# EasyEDA Pro project ProProject_F4_2025-05-21.epro, board PCB1
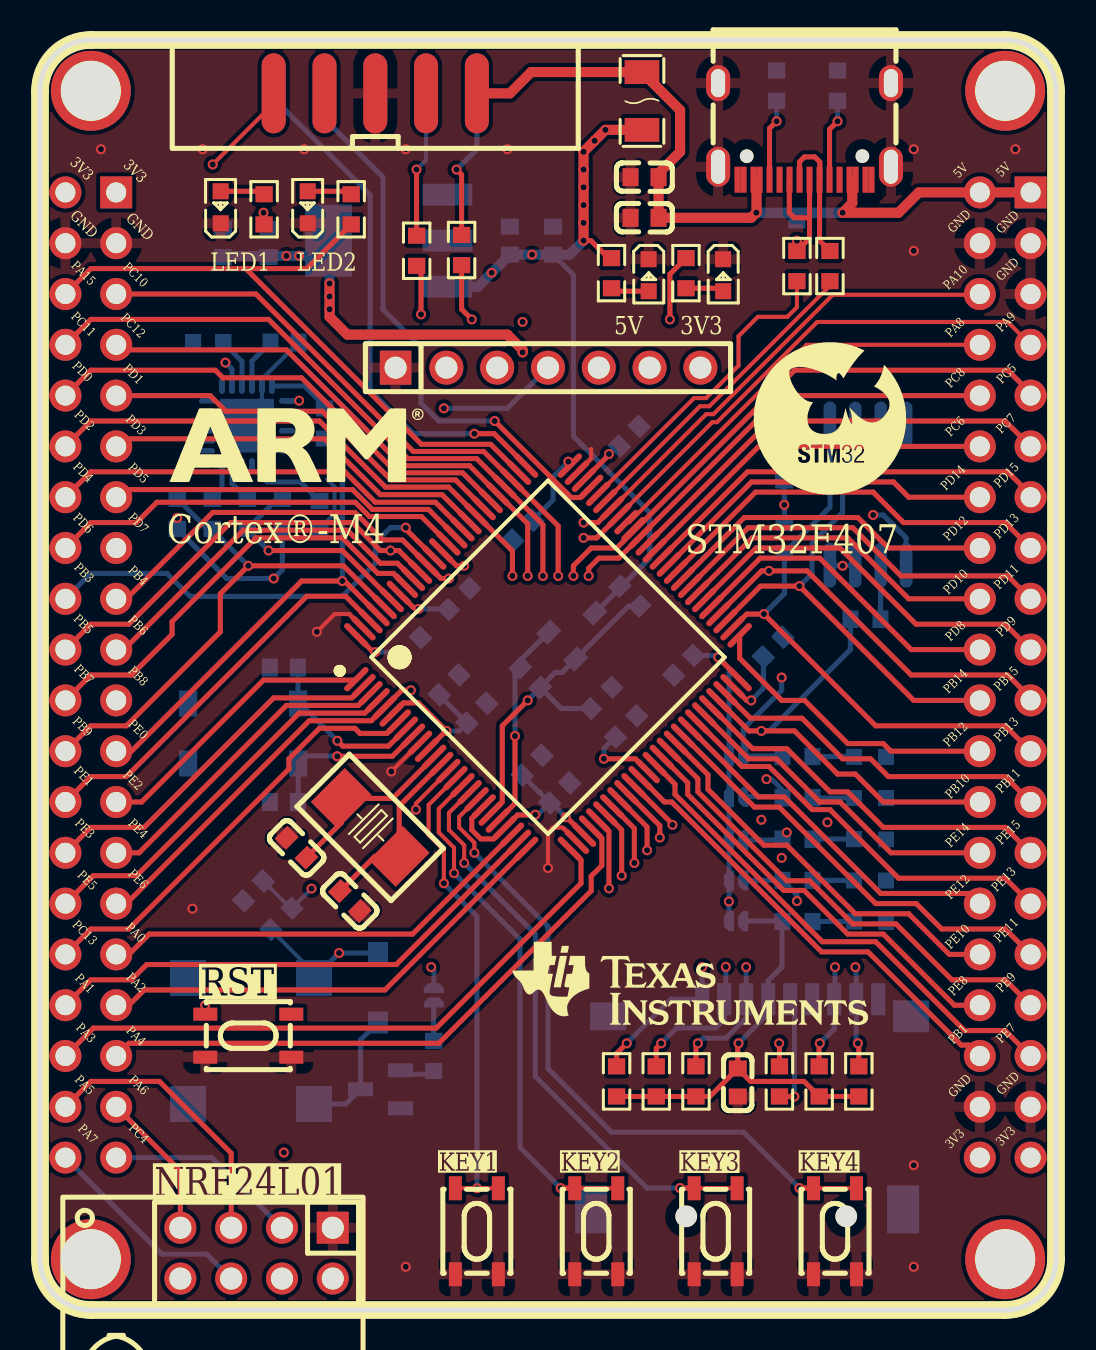
[diagram p10: board, top side]
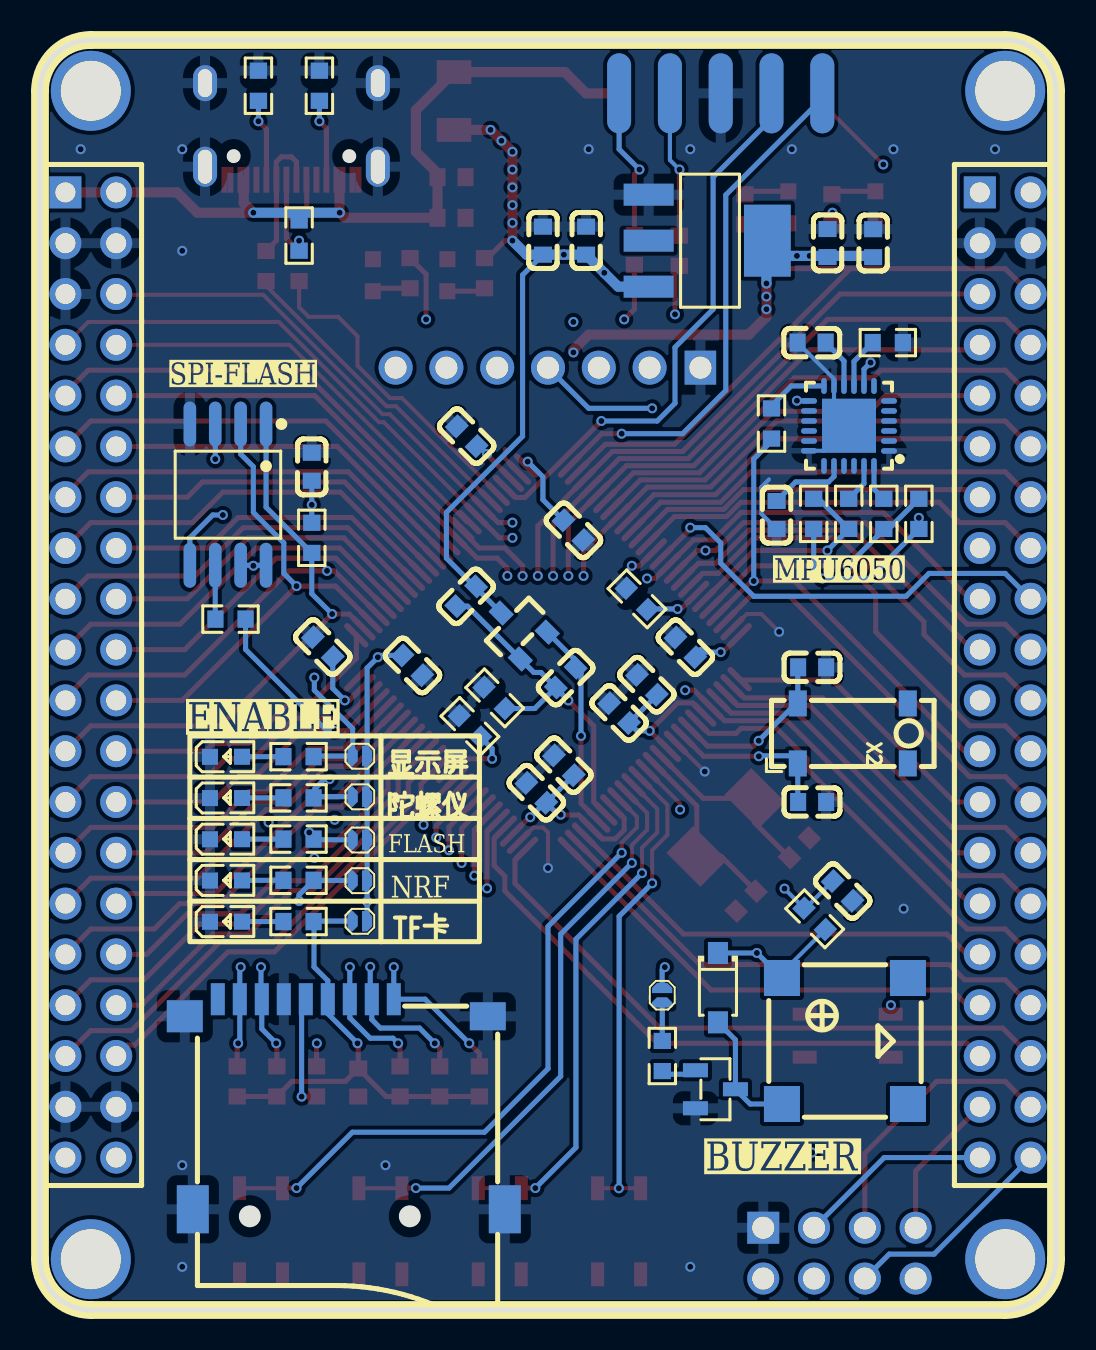
[diagram p11: board, bottom side, seen from below]

Outline 50.8 x 63.5 mm; copper layers: Top Layer, Inner1, Inner2, Bottom Layer. Coordinates in mm from the lower left corner of the outline.
Outline path: 0,60.96 0,2.54 arc(0.74,0.74) 2.54,0 48.26,0 arc(50.06,0.74) 50.8,2.54 50.8,60.96 arc(50.06,62.76) 48.26,63.5 2.54,63.5 arc(0.74,62.76) 0,60.96
Stack: Top Layer 0.035mm 外层铜厚1oz / Dielectric1 0.2104mm 7628 RC49% 8.6mil / Inner1 0.0152mm 内层铜厚 / Dielectric2 1.065mm 1.1mm H/HOZ 含铜 / Inner2 0.0152mm 内层铜厚 / Dielectric3 0.2104mm 7628 RC49% 8.6mil / Bottom Layer 0.035mm 外层铜厚1oz

## Design rules (mm)
net PA12: DP2
net PA11: DP2
net OSC_OUT: DP4
net OSC_IN: DP4
net DP: DP1
net DN: DP1
net OSC32_IN: DP3
net OSC32_OUT: DP3
template: 自定义配置
spacing copperThickness1oz (default): track to track 0.102, other pairs 0.152 to 0.3
spacing copperThickness2oz: track to track 0.203, other pairs 0.152 to 0.3
track width copperThickness1oz (default): min 0.127, default 0.254, max 2.54
track width copperThickness2oz: min 0.203, default 0.254, max 2.54
differential pair differentialPair (default): width min 0.127, default 0.254, max 2.54; gap min 0.152, default 0.152
via viaSize (default): diameter min 0.399, default 0.5, max 10; hole min 0.3, default 0.3, max 6.299

## Placement (name value [footprint] x y rotation side)
BUZZER1  SMD-7525-3627-16Ω  [BUZ-SMD_4P-L7.5-W7.5-BR]  10.55 13.45 0 bottom
C1  100nF  [C0603]  11.42 53.35 270 bottom
C2  10uF  [C0603]  9.14 53.34 270 bottom
C3  100nF  [C0603]  23.5 53.47 270 bottom
C4  10uF  [C0603]  25.65 53.47 270 bottom
C5  10uF  [C0603]  30.23 54.61 0 top
C6  0.1uF  [C0603]  30.23 56.64 0 top
C13  22pF  [C0603]  12.19 25.4 180 bottom
C14  22pF  [C0603]  12.19 32.13 180 bottom
C17  100nF  [C0603]  37.21 42.16 90 bottom
C18  100nF  [C0603]  34.89 11.37 90 top
D2  1N4148W  [SOD-123F_L2.7-W1.6-LS3.8-RD]  16.9 16.12 270 bottom
H1  -  [HDR-TH_7P-P2.54-V-F]  25.4 47.12 0 top
LED1  -  [LED_0603]  41.45 27.67 180 bottom
LED2  -  [LED_0603]  34.16 51.69 270 top
LED3  -  [LED_0603]  41.45 25.61 180 bottom
LED4  -  [LED_0603]  41.45 23.55 180 bottom
LED5  -  [LED_0603]  30.44 51.69 270 top
LED6  -  [LED_0603]  41.45 21.48 180 bottom
LED7  -  [LED_0603]  41.45 19.42 180 bottom
LED8  -  [LED_0603]  9.03 55.19 90 top
LED9  -  [LED_0603]  13.38 55.19 90 top
NOREF  -  [Pad_e925]  48.26 2.54 0 top
NOREF#2  -  [Pad_e112]  48.26 60.96 0 top
NOREF#3  -  [Pad_e923]  2.54 60.96 0 top
NOREF#4  -  [Pad_e924]  2.54 2.54 0 top
NRF24L01  -  [NRF24L01]  8.64 -8.89 90 top
P1  2.54-2*5P简牛  [简牛2*5-2.54]  16.76 60.83 0 top
Q3  SS8050  [SOT-23-3_L2.9-W1.3-P1.90-LS2.4-BR]  17.03 11.04 0 bottom
R3  10kΩ  [R0603]  12.06 19.56 225 bottom
R4  20Ω  [R0603]  18.83 52.96 90 top
R5  20Ω  [R0603]  21.08 53 90 top
R7  1K5  [R0603]  37.85 53.72 270 bottom
R8  180  [R0603]  19.69 12.7 270 bottom
R16  10K  [R0603]  20.95 35.56 45 bottom
R17  0  [R0603]  28.07 30.61 45 bottom
R18  5K1  [R0603]  36.83 61.21 90 bottom
R19  5K1  [R0603]  39.88 61.21 90 bottom
R20  22Ω  [R0603]  37.85 52.2 270 top
R21  22Ω  [R0603]  39.5 52.2 270 top
R22  10K  [R0603]  29.3 29.18 45 bottom
R27  10K  [R0603]  6.86 39.81 270 bottom
R28  10K  [R0603]  12.12 39.81 270 bottom
R29  120R  [R0603]  8.61 39.81 270 bottom
R30  120R  [R0603]  10.36 39.81 270 bottom
R31  120R  [R0603]  14.22 44.32 90 bottom
R32  10K  [R0603]  8.41 48.37 0 bottom
R37  10K  [R0603]  32.8 11.43 270 top
R38  10K  [R0603]  38.96 11.43 270 top
R39  10K  [R0603]  40.94 11.43 270 top
R40  10K  [R0603]  28.83 11.43 270 top
R41  10K  [R0603]  30.81 11.43 270 top
R42  22  [R0603]  36.97 11.43 90 top
R44  22  [R0603]  41.28 34.54 0 bottom
R45  10K  [R0603]  37.21 38.61 90 bottom
R46  10kΩ  [R0603]  37.87 27.67 180 bottom
R47  10kΩ  [R0603]  32.3 51.84 90 top
R48  10kΩ  [R0603]  37.87 25.61 180 bottom
R49  10kΩ  [R0603]  37.87 23.55 180 bottom
R50  10kΩ  [R0603]  28.58 51.84 90 top
R51  10kΩ  [R0603]  37.87 21.48 180 bottom
R52  10kΩ  [R0603]  37.87 19.42 180 bottom
R53  10kΩ  [R0603]  11.21 55.03 270 top
R54  10kΩ  [R0603]  15.56 55.03 270 top
RST  YTS-A016-2  [SW-SMD_4P-L4.2-W3.3-P2.15-LS4.7]  10.41 13.72 0 top
SW3  YTS-A016-2  [SW-SMD_4P-L4.2-W3.3-P2.15-LS4.7]  21.84 3.94 90 top
SW4  YTS-A016-2  [SW-SMD_4P-L4.2-W3.3-P2.15-LS4.7]  27.81 3.94 90 top
SW5  YTS-A016-2  [SW-SMD_4P-L4.2-W3.3-P2.15-LS4.7]  33.78 3.94 90 top
SW6  YTS-A016-2  [SW-SMD_4P-L4.2-W3.3-P2.15-LS4.7]  39.75 3.94 90 top
TF1  TF_CARD_SELF  [TF-SMD_TF-15-15]  35.56 10.29 270 bottom
U1  STM32F407VET6  [LQFP-100_L14.0-W14.0-P0.50-LS16.0-BL]  25.4 32.64 315 top
U2  18pF  [C0603]  12.83 23.11 135 top
U3  18pF  [C0603]  15.49 20.45 315 top
U4  PJ75AL33SA  [SOT-23_L2.9-W1.3-P1.90-LS2.4-BR]  26.92 34.04 225 bottom
U5  100nF  [C0603]  24.51 31.62 135 bottom
U6  1uF  [C0603]  29.49 35.69 135 bottom
U7  1uF  [C0603]  36.66 33.14 225 bottom
U8  1uF  [C0603]  29.46 43.69 225 bottom
U9  100nF  [C0603]  10.67 20.95 45 bottom
U10  -  [短接焊盘]  34.8 25.65 0 bottom
U11  -  [短接焊盘]  34.8 23.5 0 bottom
U12  -  [短接焊盘]  34.8 27.69 0 bottom
U13  -  [短接焊盘]  34.8 21.46 0 bottom
U14  AMS1117-3.3  [SOT-223-3_L6.5-W3.4-P2.30-LS7.0-BR]  17.4 53.47 0 bottom
U15  -  [短接焊盘]  34.8 19.43 0 bottom
U16  100nF  [C0603]  24.61 27.23 225 bottom
U17  100nF  [C0603]  21.84 29.84 225 bottom
U18  100nF  [C0603]  20.45 31.26 225 bottom
U19  100nF  [C0603]  18.53 33.13 225 bottom
U20  100nF  [C0603]  24.13 38.99 45 bottom
U29  100nF  [C0603]  25.98 25.86 225 bottom
U30  100nF  [C0603]  32.18 32.23 45 bottom
U31  1.5A快恢复保险丝-1206  [F1206]  30.1 60.45 270 top
U32  MPU-6050  [QFN-24_L4.0-W4.0-P0.50-BL-EP2.7]  10.35 44.2 90 bottom
U33  100nF  [C0603]  12.22 48.37 0 bottom
U34  100nF  [C0603]  13.97 39.75 90 bottom
U36  -  [短接焊盘]  19.69 15.75 270 bottom
U37  W25Q128JVSIQ  [SOIC-8_L5.3-W5.3-P1.27-LS8.0-BL]  41.4 40.77 0 bottom
U38  2.54-2*20  [HDR-TH_40P-P2.54-V-F-R2-C20-S2.54]  48.26 31.75 270 bottom
U39  2.54-2*20  [HDR-TH_40P-P2.54-V-F-R2-C20-S2.54]  2.54 31.75 270 bottom
USB1  typec  [USB-C-SMD_KH-TYPE-C-16P]  38.23 58.93 180 top
X1  8MHz  [OSC-SMD_L5.0-W3.2]  16.51 24.13 135 top
X2  32.768kHz  [OSC-SMD_4P-L8.0-W3.2-BL]  10.16 28.83 180 bottom

## Footprints (pads in the part's own frame, mm; a bottom-side part is the same pattern mirrored in y, then rotated)
BUZ-SMD_4P-L7.5-W7.5-BR
  rect 1.8x1.8 smd: 1(3.15,-3.15) 2(3.15,3.15) 3(-3.15,3.15) 4(-3.15,-3.15)
C0603
  rect 0.8x0.9 smd: 1(-0.7,0) 2(0.7,0)
F1206
  rect 1.19x1.728 smd: 1(-1.445,0) 2(1.445,0)
HDR-TH_7P-P2.54-V-F
  rect 1.575x1.7 hole 1.1: 1(-7.62,0)
  round 1.7 hole 1.1: 2(-5.08,0) 3(-2.54,0) 4(0,0) 5(2.54,0) 6(5.08,0) 7(7.62,0)
HDR-TH_40P-P2.54-V-F-R2-C20-S2.54
  rect 1.6x1.6 hole 1: 1(-24.13,-1.27)
  round 1.6 hole 1: 2(-24.13,1.27) 3(-21.59,-1.27) 4(-21.59,1.27) 5(-19.05,-1.27) 6(-19.05,1.27) 7(-16.51,-1.27) 8(-16.51,1.27) 9(-13.97,-1.27) 10(-13.97,1.27) 11(-11.43,-1.27) 12(-11.43,1.27) 13(-8.89,-1.27) 14(-8.89,1.27) 15(-6.35,-1.27) 16(-6.35,1.27) 17(-3.81,-1.27) 18(-3.81,1.27) 19(-1.27,-1.27) 20(-1.27,1.27) 21(1.27,-1.27) 22(1.27,1.27) 23(3.81,-1.27) 24(3.81,1.27) 25(6.35,-1.27) 26(6.35,1.27) 27(8.89,-1.27) 28(8.89,1.27) 29(11.43,-1.27) 30(11.43,1.27) 31(13.97,-1.27) 32(13.97,1.27) 33(16.51,-1.27) 34(16.51,1.27) 35(19.05,-1.27) 36(19.05,1.27) 37(21.59,-1.27) 38(21.59,1.27) 39(24.13,-1.27) 40(24.13,1.27)
LED_0603
  rect 0.8x0.8 smd: 1(-0.851,-0.01) 2(0.75,-0.005)
LQFP-100_L14.0-W14.0-P0.50-LS16.0-BL
  oval 0.3x1.6 smd: 1(-6,-7.55) 2(-5.5,-7.55) 3(-5,-7.55) 4(-4.5,-7.55) 5(-4,-7.55) 6(-3.5,-7.55) 7(-3,-7.55) 8(-2.5,-7.55) 9(-2,-7.55) 10(-1.5,-7.55) 11(-1,-7.55) 12(-0.5,-7.55) 13(0,-7.55) 14(0.5,-7.55) 15(1,-7.55) 16(1.5,-7.55) 17(2,-7.55) 18(2.5,-7.55) 19(3,-7.55) 20(3.5,-7.55) 21(4,-7.55) 22(4.5,-7.55) 23(5,-7.55) 24(5.5,-7.55) 25(6,-7.55) 51(6,7.55) 52(5.5,7.55) 53(5,7.55) 54(4.5,7.55) 55(4,7.55) 56(3.5,7.55) 57(3,7.55) 58(2.5,7.55) 59(2,7.55) 60(1.5,7.55) 61(1,7.55) 62(0.5,7.55) 63(0,7.55) 64(-0.5,7.55) 65(-1,7.55) 66(-1.5,7.55) 67(-2,7.55) 68(-2.5,7.55) 69(-3,7.55) 70(-3.5,7.55) 71(-4,7.55) 72(-4.5,7.55) 73(-5,7.55) 74(-5.5,7.55) 75(-6,7.55)
  oval 1.6x0.3 smd: 26(7.55,-6) 27(7.55,-5.5) 28(7.55,-5) 29(7.55,-4.5) 30(7.55,-4) 31(7.55,-3.5) 32(7.55,-3) 33(7.55,-2.5) 34(7.55,-2) 35(7.55,-1.5) 36(7.55,-1) 37(7.55,-0.5) 38(7.55,0) 39(7.55,0.5) 40(7.55,1) 41(7.55,1.5) 42(7.55,2) 43(7.55,2.5) 44(7.55,3) 45(7.55,3.5) 46(7.55,4) 47(7.55,4.5) 48(7.55,5) 49(7.55,5.5) 50(7.55,6) 76(-7.55,6) 77(-7.55,5.5) 78(-7.55,5) 79(-7.55,4.5) 80(-7.55,4) 81(-7.55,3.5) 82(-7.55,3) 83(-7.55,2.5) 84(-7.55,2) 85(-7.55,1.5) 86(-7.55,1) 87(-7.55,0.5) 88(-7.55,0) 89(-7.55,-0.5) 90(-7.55,-1) 91(-7.55,-1.5) 92(-7.55,-2) 93(-7.55,-2.5) 94(-7.55,-3) 95(-7.55,-3.5) 96(-7.55,-4) 97(-7.55,-4.5) 98(-7.55,-5) 99(-7.55,-5.5) 100(-7.55,-6)
NRF24L01
  rect 1.6x1.6 hole 1.1: 1(13.002,-6.003)
  round 1.6 hole 1.1: 2(10.463,-6.003) 3(13.002,-3.462) 4(10.463,-3.462) 5(13.002,-0.922) 6(10.463,-0.922) 7(13.002,1.617) 8(10.463,1.617)
OSC-SMD_4P-L8.0-W3.2-BL
  rect 0.9x1.3 smd: 1(-2.75,-1.5) 2(2.75,-1.5) 3(2.75,1.5) 4(-2.75,1.5)
OSC-SMD_L5.0-W3.2
  rect 1.9x2.4 smd: 1(-2.05,0) 2(2.05,0)
Pad_e112
  round 4 hole 3: 0(0,0)
Pad_e923
  round 4 hole 3: 0(0,0)
Pad_e924
  round 4 hole 3: 0(0,0)
Pad_e925
  round 4 hole 3: 0(0,0)
QFN-24_L4.0-W4.0-P0.50-BL-EP2.7
  oval 0.28x0.8 smd: 1(-1.25,-2) 2(-0.75,-2) 3(-0.25,-2) 4(0.25,-2) 5(0.75,-2) 6(1.25,-2) 13(1.25,2) 14(0.75,2) 15(0.25,2) 16(-0.25,2) 17(-0.75,2) 18(-1.242,2)
  oval 0.8x0.28 smd: 7(2,-1.25) 8(2,-0.75) 9(2,-0.25) 10(2,0.25) 11(2,0.75) 12(2,1.25) 19(-2,1.25) 20(-2,0.75) 21(-2,0.25) 22(-2,-0.25) 23(-2,-0.75) 24(-2,-1.25)
  rect 2.7x2.7 smd: 25(0.013,0)
R0603
  rect 0.806x0.864 smd: 1(-0.753,0) 2(0.753,0)
SOD-123F_L2.7-W1.6-LS3.8-RD
  rect 1.1x1 smd: 1(-1.735,0) 2(1.735,0)
SOIC-8_L5.3-W5.3-P1.27-LS8.0-BL
  oval 0.63x2.25 smd: 1(-1.905,-3.53) 2(-0.635,-3.53) 3(0.635,-3.53) 4(1.905,-3.53) 5(1.905,3.53) 6(0.635,3.53) 7(-0.635,3.53) 8(-1.905,3.53)
SOT-23-3_L2.9-W1.3-P1.90-LS2.4-BR
  rect 1.25x0.7 smd: 1(1,-0.95) 2(1,0.95) 3(-1,0)
SOT-23_L2.9-W1.3-P1.90-LS2.4-BR
  rect 1x0.8 smd: 1(1.15,-0.95) 2(1.15,0.95) 3(-1.15,0)
SOT-223-3_L6.5-W3.4-P2.30-LS7.0-BR
  rect 2.5x1.1 smd: 1(2.97,-2.3) 2(2.97,0) 3(2.97,2.3)
  rect 2.34x3.6 smd: 4(-2.97,0)
SW-SMD_4P-L4.2-W3.3-P2.15-LS4.7
  rect 1.2x0.65 smd: 1(-2.15,1.075) 2(2.15,1.075) 3(-2.15,-1.075) 4(2.15,-1.075)
TF-SMD_TF-15-15
  rect 1.6x0.701 smd: 1(-5.252,2.45) 2(-5.252,1.35) 3(-5.252,0.25) 4(-5.252,-0.85) 5(-5.252,-1.95) 6(-5.252,-3.05) 7(-5.252,-4.15) 8(-5.252,-5.25) 9(-5.252,-6.35)
  rect 1.6x1.8 smd: 10(-4.399,-8)
  rect 2.4x1.6 smd: 11(5.252,-7.6) 12(5.252,8)
  rect 1.399x1.801 smd: 13(-4.398,7.151)
USB-C-SMD_KH-TYPE-C-16P
  oval 1.2x2 hole 0.7x1.7: 1(-4.32,1.765) 2(4.32,1.765)
  oval 1.2x1.8 hole 0.7x1.4: 3(-4.32,-2.415) 4(4.32,-2.415)
  rect 0.3x1.3 smd: A1(-3.35,2.415) A4(-2.55,2.415) A5(-1.25,2.415) A6(-0.25,2.415) A7(0.25,2.415) A8(1.25,2.415) A9(2.55,2.415) A12(3.35,2.415) B1(3.05,2.415) B4(2.25,2.415) B5(1.75,2.415) B6(0.75,2.415) B7(-0.75,2.415) B8(-1.75,2.415) B9(-2.25,2.415) B12(-3.05,2.415)
短接焊盘
  custom 0.508x1.016 smd: 1(-0.353,-0.008) 2(0.368,-0.015)
简牛2*5-2.54
  oval 1.2x4 smd: 1(-5.08,0) 3(-2.54,0) 5(0,0) 7(2.54,0) 9(5.08,0)
  oval 1.2x4 smd far side: 2(-5.08,0) 4(-2.54,0) 6(0,0) 8(2.54,0) 10(5.08,0)

## Nets
As in the schematic, except:
GND: C1.1 C2.1 C3.1 C4.1 C5.1 C6.1 C13.2 C14.2 C17.2 C18.1 H1.1 LED1.1 LED2.1 LED3.1 LED4.1 LED5.1 LED6.1 LED7.1 LED8.1 LED9.1 NRF24L01.1 P1.5 P1.6 Q3.2 R16.2 R17.2 R18.2 R19.2 R22.2 R32.1 RST.3 RST.4 SW3.1 SW3.3 SW4.1 SW4.3 SW5.1 SW5.3 SW6.1 SW6.3 TF1.6 TF1.10 TF1.11 TF1.12 TF1.13 U1.10 U1.27 U1.74 U1.99 U2.2 U3.2 U7.1 U8.1 U9.1 U14.1 U16.1 U17.1 U18.1 U19.1 U20.1 U29.1 U30.1 U32.1 U32.11 U32.18 U32.25 U33.2 U34.1 U37.4 U38.3 U38.4 U38.5 U38.37 U38.38 U39.3 U39.4 USB1.1 USB1.2 USB1.3 USB1.4 USB1.A1 USB1.B12
KEY1: SW3.2 SW3.4 U1.15
KEY2: SW4.2 SW4.4 U1.16
KEY3: SW5.2 SW5.4 U1.17
KEY4: SW6.2 SW6.4 U1.18

Pads without a net: BUZZER1 3 4; H1 7; NOREF 0; NOREF#2 0; NOREF#3 0; NOREF#4 0; P1 3 7; RST 2; TF1 9; U14 2; U32 2 3 4 5 6 7 14 15 16 17 19 21 22; USB1 A8 B8; X2 2 3

## Via types
v1: diameter 0.503, hole 0.299, Top Layer to Bottom Layer, 12 vias
v2: diameter 0.5, hole 0.3, Top Layer to Bottom Layer, 119 vias

## Routing (per net, layer and track width the routed paths; a pad name or vN(x,y) marks a point on that pad's centre or on a via; arc(x,y) is an arc through that point)
3V3: length 82.9
  Top Layer w0.254: v2(33.91,32.64) 33.91,32.62 34.98,31.54 ; U1.28 26.33,24.64 v2(26.29,24.64) ; U1.6 18.16,30.35 18.92,30.35 v2(20.32,28.96) 20.3,28.96 U1.11 ; v2(16.76,32.89) 16.66,32.89 15.82,33.73 ; U1.19 21.59,24.59 21.59,24 22.04,23.55 22.68,23.55 U1.22 23.88,24.75 24.75,24.75 v2(24.77,24.77) ; R47.2 31.5,51.79 v2(31.5,49.53)
  Top Layer w0.508: v2(14.48,51.33) v2(14.48,50.67) v2(14.48,50.04) 14.48,49.66 15.37,48.77 23.37,48.77 24.13,48.01 v2(24.13,47.88)
  Inner1 w0.254: v2(31.5,49.53) 30.48,48.51 29.59,48.51 29.21,48.13 29.21,45.21 v2(26.42,42.42) ; v2(24.13,47.88) v2(24.13,49.4)
  Bottom Layer w0.203: R3.2 13.7,16.86 BUZZER1.1
  Bottom Layer w0.254: 24.98,25.87 25,25.89 24.96,25.89 ; 24.98,25.87 24.96,25.89 ; 24.98,25.87 U29.2 25.56,25.36 v2(26.29,24.64) ; U16.2 24.96,25.89 ; v2(20.32,28.96) 20.96,28.96 21.35,29.35 19.96,30.74 U18.2 ; 17.78,32.89 v2(16.76,32.89) ; 25.49,25.36 24.89,24.77 v2(24.77,24.77) ; BUZZER1.1 v2(14.95,17.85) D2.1 ; U30.2 33.82,32.73 v2(33.91,32.64) 34.44,32.1 U12.1 U10.1 U11.1 v2(34.44,20.43) U15.1 ; v2(26.42,42.42) 25.65,41.66 25.65,40.51 U20.2
  Bottom Layer w0.508: 18.03,32.64 17.78,32.89 ; v2(14.48,51.33) 14.48,53.42 U14.4 13.67,52.7 v2(12.95,52.7) v2(12.32,52.7) 9.21,52.7 C2.2
5V: length 38.5
  Top Layer w0.254: 28.58,52.44 27.55,53.47 v2(27.18,53.47)
  Top Layer w0.508: U31.2 v2(28.27,59.01) v2(27.73,58.46) v2(27.18,57.91) v2(27.18,57.02) v2(27.18,56.13) v2(27.18,55.25) v2(27.18,54.36) v2(27.18,53.47)
  Bottom Layer w0.254: 27.74,34.85 30.48,37.59 30.48,39.88 26.67,43.69 26.67,51.75 C4.2
  Bottom Layer w0.508: U14.3 21.9,51.17 v2(22.59,51.86) C3.2 v2(24.61,52.77) C4.2 26.48,52.77 v2(27.18,53.47)
AGND: length 17
  Top Layer w0.254: U1.20 23.11,25.4 23.11,29.21 v2(24.38,30.48)
  Bottom Layer w0.254: v2(24.38,30.48) 25.01,31.1 U5.1 ; U6.1 29.42,35.19 U4.1 26.11,31.88 25.75,31.88 U5.1 ; U5.1 26.06,30.07 R17.1
GND: length 20.9
  Top Layer w0.203: 19,28.36 v2(17.56,26.92) 17.53,26.92 ; 27.56,43.05 27.56,42.58 26.85,41.87 ; v2(13.84,33.91) 14.73,34.8 15.46,34.8 U1.99 ; v2(25.4,22.1) 25.4,23.88 25.65,24.12 26.14,24.12 U1.27
  Bottom Layer w0.203: 14.35,41.53 14.73,41.15 14.73,39.81 U34.1 ; U32.18 11.6,42.96 U32.25 11.1,44.97 U32.11 11.1,46.55 U33.2
  vias: v1(3.05,58.04) v1(8.13,58.04) v1(13.21,58.04) v1(18.29,58.04) v1(18.29,2.16) v1(23.37,58.04) v1(33.53,7.24) v1(43.69,58.04) v1(43.69,52.96) v1(43.69,7.24) v1(43.69,2.16) v1(48.77,58.04) v2(7.62,20.07)
VIN: length 39.8
  Top Layer w0.508: 40.61,56.42 40.61,55.34 v2(40.13,54.86) 42.93,54.86 43.94,55.88 U38.2 U38.1 ; 35.81,56.52 35.83,56.51 35.83,54.88 35.56,54.61 C5.2 C6.2 30.93,56.83 32,57.91 32,59.99 U31.1 24.56,61.9 23.5,60.83 P1.9
  Bottom Layer w0.508: v2(40.13,54.86) v2(35.81,54.86)
BOOT0: length 2.8
  Top Layer w0.254: v2(18.92,35.05) 18.86,35.12 18.68,35.12 U1.94
  Bottom Layer w0.254: R16.1 20.39,35.05 v2(18.92,35.05)
BOOT1: length 3.8
  Top Layer w0.254: v2(28.19,27.56) 29.77,27.56 30.39,26.95
  Bottom Layer w0.254: R22.1 28.19,28.07 v2(28.19,27.56)
BUZZER: length 1.9
  Bottom Layer w0.254: R8.1 19.69,15.37 U36.2
CC1: length 4.1
  Top Layer w0.254: v2(39.88,59.44) 39.48,59.03 USB1.A5
  Bottom Layer w0.254: v2(39.88,59.44) R19.1
CC2: length 4.1
  Top Layer w0.254: v2(36.83,59.44) 36.48,59.08 USB1.B5
  Bottom Layer w0.254: v2(36.83,59.44) R18.1
DN: length 6.8
  Top Layer w0.254: USB1.A7 37.98,57.41 38.23,57.66 38.74,57.66 38.99,57.4 38.99,56.53 USB1.B7 38.98,53.47 R21.1
DP: length 6.6
  Top Layer w0.254: R20.1 38.48,53.58 38.48,54.61 ; USB1.B6 37.47,56.5 37.47,54.86 37.72,54.61 38.48,54.61 ; 38.48,54.61 USB1.A6
  vias: v2(37.85,53.47)
FLASH_VCC: length 21.6
  Inner2 w0.254: v2(40.13,37.21) 40.13,26.67 v2(37.34,23.88)
  Bottom Layer w0.254: C17.1 v2(37.21,40.26) R45.2 ; U11.2 37.09,23.51 R49.2 ; U37.8 U37.7 ; v2(42.04,42.55) U37.3
KEY1: length 24.2
  Top Layer w0.203: U1.15 19.43,25.26 19.43,23.75 20.19,22.99 v2(20.19,21.34) ; SW3.2 v2(21.86,6.09) 22.92,6.09
  Bottom Layer w0.254: v2(20.19,21.34) 21.84,19.69 21.84,6.1
KEY2: length 26
  Top Layer w0.203: U1.16 19.94,25.06 19.94,23.88 20.7,23.11 v2(20.7,21.84) ; SW4.2 SW4.4
  Top Layer w0.254: SW4.2 26.73,6.1 v2(26.03,6.1)
  Bottom Layer w0.254: v2(26.03,6.1) 24,8.13 24,18.54 v2(20.7,21.84)
KEY3: length 28.8
  Top Layer w0.203: v2(21.21,22.35) 21.21,23.24 20.45,24 20.45,24.86 U1.17 ; SW5.2 SW5.4
  Top Layer w0.254: v2(32,6.1) 32.7,6.1 SW5.2
  Bottom Layer w0.254: v2(21.21,22.35) 24.77,18.8 24.77,11.68 30.35,6.1 v2(32,6.1)
KEY4: length 33.7
  Top Layer w0.203: SW6.2 SW6.4 ; U1.18 20.96,24.66 20.96,24.13 21.72,23.37 v2(21.72,22.86)
  Top Layer w0.254: v2(37.97,6.1) 38.67,6.1 SW6.2
  Bottom Layer w0.254: v2(21.72,22.86) 25.4,19.18 25.4,12.06 28.58,8.89 35.18,8.89 v2(37.97,6.1) 38.1,6.1
LCD_DC: length 36.1
  Top Layer w0.254: U39.17 4.32,35.56 8.64,39.88 15.75,39.88 17.12,38.5 18.12,38.5 U1.90 20.05,36.58 v2(20.45,36.58)
  Inner2 w0.254: v2(20.45,36.58) 22.61,36.58 28.07,42.04 28.7,42.04 30.48,43.81 H1.6
LCD_RES: length 32.9
  Top Layer w0.254: U1.88 20.83,37.21 v2(21.21,37.21)
  Inner2 w0.254: U39.15 4.57,38.1 5.08,38.61 12.45,38.61 13.84,37.21 v2(21.21,37.21) 22.1,37.21 27.94,43.05 H1.5
LCD_SCL: length 32
  Top Layer w0.254: v2(18.29,39.12) 18.29,39.04 U1.89
  Inner2 w0.254: H1.3 22.86,46.14 18.29,41.57 v2(18.29,39.12)
  Bottom Layer w0.254: v2(18.29,39.12) 17.53,39.12 16.76,38.35 16.76,37.34 15.11,35.69 7.49,35.69 6.35,36.83 2.54,36.83 U39.18
LCD_SDA: length 35.6
  Top Layer w0.254: U39.20 2.54,34.29 4.44,34.29 9.53,39.37 15.62,39.37 17.02,37.97 v2(17.53,37.97) 17.94,37.97 U1.91
  Inner2 w0.254: v2(17.53,37.97) 17.53,42.42 v2(20.19,45.08)
  Bottom Layer w0.254: v2(20.19,45.08) 23.37,45.08 H1.4
LCD_VCC: length 39.4
  Inner2 w0.254: v2(37.08,31.62) 37.08,32.64 35.43,34.29 35.43,47.62 34.54,48.51 21.72,48.51 H1.2
  Bottom Layer w0.254: R46.2 37.09,27.7 U12.2 35.17,29.07 37.08,30.99 v2(37.08,31.62)
LED1: length 40
  Top Layer w0.254: U1.81 21.13,41.86 17.83,41.86 13.08,46.61 9.14,46.61 8.76,46.99 2.54,46.99 U39.10
  Inner2 w0.254: U39.10 2.54,46.99 6.35,46.99 11.18,51.82 v2(11.18,54.86)
LED2: length 33.6
  Top Layer w0.254: R54.2 13.35,52.07 10.29,52.07 ; 23.95,41.87 22.53,43.29 19.07,43.29 10.29,52.07 ; U39.6 2.54,52.07 10.29,52.07
MPU_INT: length 24.8
  Top Layer w0.254: U39.23 4.57,27.94 13.08,36.45 v2(15.11,36.45) 15.23,36.45 U1.97
  Bottom Layer w0.254: 14.1,43.57 15.11,42.55 v2(15.11,36.45)
MPU_SCL: length 22.1
  Top Layer w0.254: U1.95 15.12,37.97 v2(11.43,37.97)
  Inner2 w0.254: v2(11.43,37.97) 11.43,37.47 4.44,30.48 U39.21
  Bottom Layer w0.254: R28.1 11.87,40.56 10.36,39.05 10.36,39.04 v2(11.43,37.97)
MPU_SDA: length 26.7
  Top Layer w0.254: 17.23,35.15 15.17,37.21 v2(10.41,37.21) 9.02,35.81 9.02,33.91 4.32,29.21 2.54,29.21 U39.24
  Bottom Layer w0.254: R27.1 8.36,39.05 8.61,39.05 8.61,39.01 v2(10.41,37.21)
MPU_VCC: length 43.1
  Inner2 w0.254: v2(36.32,26.54) 24,26.54 13.97,36.58 v2(11.68,36.58)
  Bottom Layer w0.254: v2(12.95,45.47) 12.89,45.47 12.88,45.45 U32.13 ; v2(6.86,39.61) 6.86,39.05 9.34,36.58 v2(11.68,36.58) 12.12,37.01 12.12,39.05 ; v2(36.32,26.54) 36.58,26.54 37.06,26.06 37.06,25.67 ; 37.06,25.67 U10.2 ; 37.06,25.67 R48.2 ; v2(9.27,47.37) 9.6,47.04 U32.8
NRF_CE: length 40.8
  Top Layer w0.254: U1.33 30.35,24.15 v2(30.35,22.99)
  Inner1 w0.254: v2(30.35,22.99) 30.35,19.81 16.26,5.72 13.7,5.72 NRF24L01.3
  Bottom Layer w0.254: NRF24L01.3 8.59,7.62 U39.39
NRF_CS: length 34.4
  Top Layer w0.254: U1.34 30.99,24.22 v2(30.99,23.62)
  Inner1 w0.254: v2(30.99,23.62) 30.99,19.56 16.51,5.08 16.51,3.3 16,2.79 13.72,2.79 12.49,1.57 NRF24L01.4
NRF_IRQ: length 42.3
  Top Layer w0.254: U1.35 31.62,24.29 v2(31.62,24.26)
  Inner1 w0.254: v2(31.62,24.26) 31.62,19.3 17.53,5.21 17.53,2.41 15.54,0.43 8.16,0.43 NRF24L01.8
NRF_MISO: length 41.1
  Top Layer w0.254: U1.31 29.08,24.01 v2(29.08,21.72) ; U39.37 7.02,6.95 NRF24L01.7
  Inner1 w0.254: NRF24L01.7 7.02,4.22 9.91,7.11 15.88,7.11 29.08,20.32 v2(29.08,21.72)
NRF_MOSI: length 45.6
  Top Layer w0.254: v2(29.72,22.35) 29.72,24.08 U1.32
  Inner1 w0.254: v2(29.72,22.35) 29.72,20.07 16,6.35 11.94,6.35 10.8,5.21 10.8,2.79 9.57,1.57 NRF24L01.6
  Bottom Layer w0.254: NRF24L01.6 8.34,2.79 6.1,2.79 U39.40
NRF_SCK: length 44.4
  Top Layer w0.254: v2(28.45,21.08) 28.45,23.93 U1.30 ; NRF24L01.5 9.56,7.84 5.97,11.43 2.54,11.43 U39.38
  Inner1 w0.254: v2(28.45,21.08) 28.45,20.7 15.62,7.87 v2(12.19,7.87)
  Inner2 w0.254: NRF24L01.5 9.56,5.24 v2(12.19,7.87)
NRF_VCC: length 35.6
  Inner2 w0.254: v2(37.85,20.45) 37.85,18.29 35.18,15.62 29.59,15.62 15.54,1.57 NRF24L01.2
  Bottom Layer w0.254: U13.2 37.11,21.48 R51.2 37.85,20.76 v2(37.85,20.45)
NRST: length 64.1
  Top Layer w0.203: v2(8.64,57.28) 11.81,60.45 11.81,60.96 ; 20.41,26.95 18.8,25.33 v2(18.8,25.02)
  Inner1 w0.203: v2(13.58,21.07) 14.85,21.07 v2(18.8,25.02)
  Inner1 w0.254: v2(13.58,21.07) 8.64,26.01 v2(8.64,57.28)
  Inner2 w0.254: v2(8.25,15.24) 8.25,15.75 v2(13.58,21.07)
  Bottom Layer w0.203: 11.16,21.45 12.52,20.09 R3.1 v2(13.58,21.07)
OSC32_IN: length 8.4
  Top Layer w0.254: v2(14.87,28.46) 15.13,28.19 17.42,28.19 U1.8
  Bottom Layer w0.254: v2(14.87,28.46) 13,30.33 X2.4 12.91,32.11 C14.1
OSC32_OUT: length 8.3
  Top Layer w0.254: v2(14.86,27.69) 17.62,27.69 U1.9
  Bottom Layer w0.254: v2(14.86,27.69) 14.84,27.71 13.29,27.71 X2.1 12.91,25.42 C13.1
OSC_IN: length 9.2
  Top Layer w0.254: U2.1 15.06,24.36 X1.2 17.63,25.58 U1.12
OSC_OUT: length 9.2
  Top Layer w0.254: U3.1 16.74,22.68 X1.1 17.96,25.2 U1.13
PA0: length 22.3
  Top Layer w0.254: U39.31 4.44,17.78 5.46,18.8 18.63,18.8 U1.23
PA1: length 26.1
  Top Layer w0.254: U1.24 17.81,17.27 5.33,17.27 4.57,16.51 2.54,16.51 U39.34
PA2: length 23.7
  Top Layer w0.254: U39.33 4.44,15.24 5.21,16 17.25,16 U1.25
PA3: length 31.3
  Top Layer w0.254: U1.26 27.05,22.5 27.05,21.34 19.81,14.1 2.67,14.1 U39.36
PA4: length 30.8
  Top Layer w0.254: U39.35 4.44,13.33 19.94,13.33 27.56,20.95 27.56,21.69 28.09,22.22 28.09,23.58 U1.29
PA8: length 21.3
  Top Layer w0.203: U38.8 38.33,48.26 29.46,39.39 U1.67
PA9: length 45.3
  Top Layer w0.203: U38.7 48.39,49.4 38.86,49.4 33.85,44.39 33.62,44.39 U1.68
  Top Layer w0.254: U1.68 27.83,38.61 v2(27.18,38.61) ; R4.1 19.05,51.99 v2(19.05,49.78)
  Inner1 w0.254: v2(19.05,49.78) 19.05,45.08 25.53,38.61 v2(27.18,38.61)
PA10: length 40.3
  Top Layer w0.203: 28.62,40.1 33.31,44.79 33.67,44.79 39.64,50.76 46.99,50.76 U38.6
  Top Layer w0.254: 28.62,40.1 27.89,39.37 v2(27.18,39.37) ; R5.1 21.08,50.04 v2(21.59,49.53)
  Inner1 w0.254: v2(21.59,49.53) 21.59,46.48 25.02,43.05 25.02,41.02 26.67,39.37 v2(27.18,39.37)
PA11: length 15.9
  Top Layer w0.203: R21.2 39.5,51.22 33.47,45.19 33,45.19 U1.70
PA12: length 16
  Top Layer w0.203: R20.2 37.85,50.14 37.36,49.66 35.89,49.66 34.93,48.69 34.93,47.22 33.3,45.6 32.7,45.6 U1.71
PA13: length 28.2
  Top Layer w0.254: v2(22.73,44.45) 26.56,40.62 27.02,40.62 U1.72
  Bottom Layer w0.254: v2(22.73,44.45) 19.94,44.45 19.05,45.34 19.05,48.13 17.15,50.04 17.15,56.64 14.35,59.44 14.35,60.96
PA14: length 26.3
  Top Layer w0.254: U1.76 22.71,43.81 v2(21.72,43.81)
  Bottom Layer w0.254: v2(21.72,43.81) 18.67,43.81 16.51,45.97 16.51,55.75 11.81,60.45 11.81,60.96
PB1: length 22.7
  Top Layer w0.254: U1.36 31.22,25.4 31.58,25.4 39.08,17.91 41.4,17.91 46.06,13.25 46.44,13.25 U38.36
PB6: length 18.3
  Top Layer w0.254: U1.92 17.87,37.34 17.02,37.34 15.37,38.99 10.16,38.99 4.19,33.02 U39.19
PB7: length 21.8
  Top Layer w0.254: U1.93 17.67,36.83 16.89,36.83 15.11,38.61 10.8,38.61 6.6,34.42 6.6,33.78 4.57,31.75 2.54,31.75 U39.22
PB10: length 22.8
  Top Layer w0.254: U1.47 35.45,28.96 v2(36.07,28.96) 37.72,28.96 39.88,26.8 40.77,26.8 42.16,25.4 U38.26
  Bottom Layer w0.254: R44.1 40.52,33.03 36.45,28.96 v2(36.07,28.96)
PB11: length 17.5
  Top Layer w0.254: U38.25 48.26,26.67 42.42,26.67 41.53,27.56 40.13,27.56 38.1,29.59 35.52,29.59 U1.48
PB12: length 15.1
  Top Layer w0.254: 34.98,33.73 34.98,32.58 37.08,30.48 38.23,30.48 40.39,28.32 42.16,28.32 42.55,27.94 U38.24
PB13: length 28.9
  Top Layer w0.254: U1.52 35.34,34.8 v2(36.19,34.8) 41.78,29.21 48.26,29.21 U38.23
  Bottom Layer w0.254: U37.1 39.5,40.14 R45.1 37.21,35.81 v2(36.19,34.8)
PB14: length 25.1
  Top Layer w0.254: U1.53 36.03,36.19 v2(37.97,36.19) 43.69,30.48 U38.22
  Bottom Layer w0.254: v2(37.97,36.19) 38.61,36.83 38.61,38.35 40.13,39.88 40.13,42.16 40.77,42.8 U37.2
PB15: length 29.1
  Top Layer w0.254: U38.21 49.53,30.61 48.39,31.75 43.56,31.75 38.35,36.96 v2(36.45,36.96) 36.08,36.96 U1.54
  Inner1 w0.254: v2(41.66,39.75) 39.24,39.75 v2(36.45,36.96)
  Bottom Layer w0.254: v2(41.66,39.75) 42.16,39.75 43.31,38.61 U37.5
PC6: length 18.4
  Top Layer w0.254: U1.63 35.94,43.18 U38.12
PC7: length 22.2
  Top Layer w0.254: U38.11 48.26,44.45 36.5,44.45 30.39,38.33
PC8: length 53.5
  Top Layer w0.254: v2(27.43,36.7) 27.43,37.08 27.94,37.59 28.94,37.59 U1.65 37.07,45.72 U38.10 ; v2(38.99,13.33) 38.96,13.3 R38.1
  Inner1 w0.254: v2(39.37,24.38) 27.43,36.32 v2(27.43,36.7)
  Inner2 w0.254: v2(39.37,24.38) 39.75,24 v2(39.75,17.14)
  Bottom Layer w0.254: v2(39.75,17.14) 39.75,15.58 TF1.7 39.71,14.06 v2(38.99,13.33)
PC9: length 58.4
  Top Layer w0.254: U38.9 49.53,45.85 48.39,46.99 37.73,46.99 28.84,38.1 27.56,38.1 26.67,37.21 v2(26.67,36.7) ; R39.1 40.94,13.29 v2(40.89,13.33)
  Inner1 w0.254: v2(40.77,17.14) 40.77,21.21 26.67,35.31 v2(26.67,36.7)
  Bottom Layer w0.254: v2(40.89,13.33) 40.81,13.42 TF1.8 40.81,17.1 v2(40.77,17.14)
PC10: length 62
  Top Layer w0.254: v2(25.91,36.7) 25.91,39.2 22.18,42.93 18.67,42.93 10.8,50.8 U39.5 ; R40.1 28.83,12.83 v2(29.34,13.33)
  Inner1 w0.254: v2(25.91,36.7) 25.91,34.67 v2(36.07,24.51)
  Inner2 w0.254: v2(33.11,17.15) 36.07,20.1 v2(36.07,24.51)
  Bottom Layer w0.254: v2(33.11,17.15) TF1.1 31.54,15.54 v2(29.34,13.33)
PC11: length 64.4
  Top Layer w0.254: R41.1 30.81,13.09 v2(31.06,13.33) ; v2(25.15,36.7) 25.15,39.26 U1.79 21.83,42.57 18.39,42.57 11.43,49.53 2.54,49.53 U39.8
  Inner1 w0.254: v2(37.08,22.61) 25.15,34.54 v2(25.15,36.7)
  Inner2 w0.254: v2(34.29,17.16) 37.08,19.95 v2(37.08,22.61)
  Bottom Layer w0.254: v2(34.29,17.16) 34.29,15.62 TF1.2 34.21,14.53 33.78,14.1 31.82,14.1 v2(31.06,13.33)
PC12: length 56.6
  Top Layer w0.254: U39.7 4.06,48.01 12.32,48.01 18.11,42.22 21.48,42.22 U1.80 24.38,39.31 v2(24.38,36.7) ; v2(36.96,13.33) 36.97,13.32 R42.2
  Inner1 w0.254: v2(24.38,36.7) 24.38,33.66 36.96,21.08 v2(36.96,13.33)
PC13: length 22
  Top Layer w0.254: U1.7 17.35,28.83 16,28.83 15.75,29.08 13.97,29.08 12.45,27.56 12.45,27.05 4.44,19.05 2.54,19.05 U39.32
PD1: length 20.7
  Top Layer w0.254: 22.18,40.1 20.78,41.5 17.55,41.5 14.12,44.94 9.29,44.94 8.51,45.72 U39.9
PD2: length 57.9
  Top Layer w0.254: v2(23.62,36.7) 23.62,37.95 U1.83 20.43,41.15 17.27,41.15 13.97,44.45 2.54,44.45 U39.12 ; R37.1 32.8,13.24 v2(32.89,13.33)
  Inner1 w0.254: v2(35.31,17.14) 35.31,21.59 23.62,33.27 v2(23.62,36.7)
  Bottom Layer w0.254: v2(32.89,13.33) 33.15,13.59 34.29,13.59 35.31,14.61 TF1.3 35.31,17.14 v2(35.31,17.14)
PD3: length 19.6
  Top Layer w0.254: U1.84 20.1,40.77 17.02,40.77 14.22,43.56 4.19,43.56 U39.11
PD4: length 21.6
  Top Layer w0.254: U1.85 19.77,40.39 16.76,40.39 15.24,41.91 2.54,41.91 U39.14
PD5: length 18.1
  Top Layer w0.254: U1.86 19.42,40.03 16.62,40.03 15.63,41.02 4.19,41.02 U39.13
PD6: length 20.9
  Top Layer w0.254: U39.16 2.54,39.37 4.83,39.37 5.84,40.39 15.76,40.39 16.47,39.67 19.07,39.67 20.41,38.33
PD8: length 16.3
  Top Layer w0.254: U38.20 43.56,33.02 38.99,37.59 36.01,37.59 33.57,35.15
PD9: length 19.5
  Top Layer w0.254: U38.19 48.26,34.29 43.8,34.29 39.99,38.1 35.81,38.1 U1.56
PD10: length 16.5
  Top Layer w0.254: U1.57 35.61,38.61 40.39,38.61 43.43,35.56 U38.18
PD11: length 19.7
  Top Layer w0.254: U1.58 35.41,39.12 40.64,39.12 43.05,36.7 48.39,36.7 U38.17
PD12: length 16.7
  Top Layer w0.254: U38.16 42.42,38.1 40.89,39.62 35.21,39.62 U1.59
PD13: length 20.5
  Top Layer w0.254: U1.60 35.78,40.89 41.66,40.89 43.18,39.37 48.26,39.37 U38.15
PD14: length 17.6
  Top Layer w0.254: U1.61 35.58,41.4 42.67,41.4 43.43,40.64 U38.14
PD15: length 20.8
  Top Layer w0.254: U1.62 35.38,41.91 48.39,41.91 49.53,40.77 U38.13
PE1: length 20
  Top Layer w0.254: U39.26 2.54,26.67 4.32,26.67 13.34,35.69 15.28,35.69 U1.98
PE2: length 14.6
  Top Layer w0.254: U39.25 5.08,25.4 11.18,31.5 15.77,31.5 15.82,31.54
PE3: length 18.4
  Top Layer w0.254: U39.28 2.54,24.13 5.21,24.13 11.68,30.61 15.59,30.61 U1.2
PE4: length 16
  Top Layer w0.254: U39.27 4.95,22.86 12.32,30.23 15.92,30.23 U1.3
PE5: length 19.8
  Top Layer w0.254: U1.4 16.24,29.84 12.95,29.84 4.83,21.72 2.67,21.72 U39.30
PE6: length 34.5
  Top Layer w0.254: U39.29 4.32,20.32 13.46,29.46 16.57,29.46 U1.5 18.09,30.99 v2(18.54,30.99)
  Inner1 w0.254: v2(18.54,30.99) 19.56,29.97 v2(19.56,17.14)
  Bottom Layer w0.254: U36.1 19.69,17.01 v2(19.56,17.14)
PE7: length 25.1
  Top Layer w0.254: U1.38 31.75,26.29 31.75,25.78 39.12,18.42 41.78,18.42 46.23,13.97 48.26,13.97 U38.35
PE8: length 21.4
  Top Layer w0.254: U38.34 45.72,15.24 42.16,18.8 40.39,18.8 38.21,20.98 37.19,20.98 32.39,25.78 32.39,26.36 U1.39
PE9: length 23.8
  Top Layer w0.254: U38.33 48.26,16.51 45.59,16.51 42.8,19.3 40.64,19.3 38.48,21.46 37.34,21.46 32.89,25.91 32.89,26.56 U1.40
PE10: length 20
  Top Layer w0.254: 31.8,28.36 33.4,26.76 33.4,26.03 36.19,23.24 37.34,23.24 40.77,19.81 43.43,19.81 45.47,17.78 U38.32
PE11: length 21.9
  Top Layer w0.254: U38.31 48.26,19.05 45.09,19.05 43.81,20.32 41.78,20.32 36.96,25.15 35.72,25.15 U1.42
PE12: length 18.1
  Top Layer w0.254: U1.43 35.92,25.65 37.21,25.65 42.04,20.83 46.48,20.83 U38.30
PE13: length 20.4
  Top Layer w0.254: U38.29 48.26,21.59 42.93,21.59 39.5,25.02 38.61,25.02 36.45,27.18 35.1,27.18 U1.44
PE14: length 16.6
  Top Layer w0.254: U1.45 35.43,27.56 36.83,27.56 38.99,25.4 40,25.4 42.55,22.86 U38.28
PE15: length 19
  Top Layer w0.254: U38.27 48.26,24.13 42.16,24.13 40.39,25.91 39.5,25.91 37.34,28.07 35.63,28.07 U1.46
TF_VCC: length 23.5
  Top Layer w0.254: C18.2 35.53,11.43 38.2,11.43 R38.2 R39.2 ; C18.2 33.49,10.68 R37.2 R41.2 R40.2 ; C18.2 34.89,13.3 v2(34.93,13.33)
  Bottom Layer w0.254: 37.1,19.45 R52.2 ; 37.1,19.45 U15.2 ; 37.1,19.45 37.1,17.15 36.41,16.47 TF1.4 36.41,14.82 v2(34.93,13.33)
$1N1608: length 10.5
  Top Layer w0.254: U1.21 23.75,25.33 v2(23.75,28.7)
  Bottom Layer w0.254: U4.2 24.02,32.47 U5.2 23.75,31.85 v2(23.75,28.7)
$1N1611: length 3.6
  Top Layer w0.254: U1.49 35.34,30.48 v2(35.56,30.48)
  Bottom Layer w0.254: U7.2 36.16,31.08 v2(35.56,30.48)
$1N1612: length 2.5
  Top Layer w0.254: v2(28.45,42.8) 28.45,42.76 27.2,41.51
  Bottom Layer w0.254: 28.97,43.19 28.84,43.19 v2(28.45,42.8)
$1N2522: length 7.3
  Top Layer w0.254: v2(18.83,57.02) 18.83,53.72 R4.2
  Bottom Layer w0.203: P1.8 19.3,57.5 v2(18.83,57.02)
$1N2523: length 7.6
  Top Layer w0.254: v2(20.83,57.02) 21.08,56.77 R5.2
  Bottom Layer w0.254: v2(20.83,57.02) 21.84,58.04 P1.10
$1N6488: length 1.8
  Bottom Layer w0.254: R29.1 9.1,41.05 U32.24
$1N6489: length 2
  Bottom Layer w0.254: R30.1 9.6,41.32 U32.23
$1N6494: length 3.1
  Bottom Layer w0.254: 14.1,45.08 14.1,45.34 13.23,46.2 U32.12
$1N6499: length 2.6
  Bottom Layer w0.254: 9.16,48.37 10.1,47.43 U32.9
$1N6502: length 2.5
  Bottom Layer w0.254: U33.1 10.6,47.45 U32.10
$1N6503: length 3.9
  Bottom Layer w0.254: U32.20 11.1,41.68 11.37,41.4 13.02,41.4 U34.2
$1N11456: length 2.7
  Bottom Layer w0.254: U37.6 42.04,34.55 R44.2
$1N14653: length 6.3
  Bottom Layer w0.254: D2.2 16.03,13.51 Q3.3 15.29,10.3 13.7,10.3
$1N14654: length 2
  Bottom Layer w0.254: Q3.1 18.23,11.79 19.95,11.79
$1N14893: length 2.1
  Bottom Layer w0.254: LED1.2 40.7,27.67 R46.1
$1N14984: length 1.9
  Top Layer w0.254: LED2.2 34.01,51.09 R47.1
$1N15078: length 2.1
  Bottom Layer w0.254: R48.1 40.7,25.61 LED3.2
$1N15170: length 2.1
  Bottom Layer w0.254: LED4.2 40.7,23.55 R49.1
$1N15262: length 1.9
  Top Layer w0.254: LED5.2 28.72,50.94 R50.1
$1N15346: length 2.1
  Bottom Layer w0.254: R51.1 40.7,21.48 LED6.2
$1N15427: length 2.1
  Bottom Layer w0.254: LED7.2 40.7,19.42 R52.1
$1N15508: length 2.2
  Top Layer w0.254: R53.1 11.06,55.94 LED8.2
$1N19655: length 5.7
  Top Layer w0.254: R42.1 37.71,10.68 v2(37.72,10.67)
  Bottom Layer w0.254: TF1.5 37.72,15.33 v2(37.72,10.67)
$1N19842: length 2.2
  Top Layer w0.254: LED9.2 15.41,55.94 R54.1

## Copper pours and planes (outline as drawn; the poured copper is in the pictures)
3V3 on Inner2: -2.67,65.53 54.23,65.53 54.23,-4.19 -2.67,-4.19
5V on Inner2: 16.02,65.77 53.11,65.77 53.11,50.14 16.02,50.14
GND on Top Layer: -2.03,65.53 53.21,65.53 53.21,-2.03 -2.03,-2.03
GND on Bottom Layer: -7.75,67.06 55.37,67.06 55.37,-4.7 -7.75,-4.7
GND on Inner1: -0.51,68.45 51.69,68.45 51.69,-0.76 -0.51,-0.76
FLASH_VCC on Inner2: 35.67,46.57 45.56,46.57 45.56,33.62 35.67,33.62
MPU_VCC on Inner2: 6.35,36 15.42,36 15.42,49.28 8.38,49.28 6.35,47.24
TF_VCC on Inner2: 25.38,11.72 25.38,3.05 44.81,3.05 44.81,18.54 37.66,18.54 35.15,15.97 29.72,15.97

## Text on the board
Bottom Silkscreen Layer: FLASH | MPU6050 | SPI-FLASH | NRF | TF卡 | 显示屏 | 陀螺仪 | BUZZER | ENABLE
Top Silkscreen Layer: PC11 | PA15 | PD0 | PC13 | PB9 | PD6 | PD4 | PB5 | PE1 | PB3 | PB7 | PD2 | PA5 | PE3 | PA1 | PA3 | PE5 | PA7 | PC12 | PC10 | PD1 | PE2 | PD3 | PA0 | PA2 | PA4 | PD5 | PD7 | PB4 | PB6 | PB8 | PE0 | PE4 | PE6 | PA6 | PC4 | PD14 | PA10 | PD12 | PD10 | PB14 | PB12 | PA8 | PC8 | PC6 | PD8 | PB10 | PE14 | PE12 | PE10 | 3V3 | GND | PE8 | PB1 | 5V | PE13 | PD15 | PD13 | PD11 | PB15 | PB13 | PE11 | PA9 | PC7 | PD9 | PB11 | PE15 | PE9 | PE7 | PC5 | KEY1 | KEY2 | KEY3 | KEY4 | LED1 | LED2 | NRF24L01 | Cortex®-M4 | STM32F407
